# Altium schematic sheet fpga_map.SchDoc
size A4; SheetNumber: 4; SheetTotal: 4
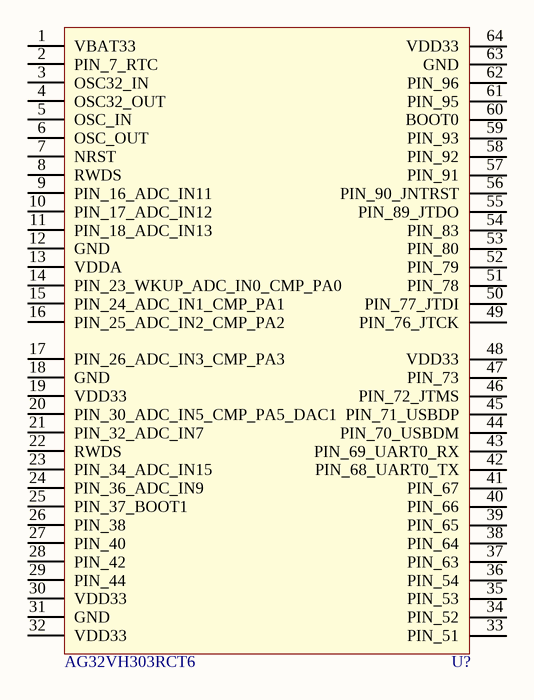
[diagram p0: fpga_map.SchDoc]

## Parts
U?  AG32VH303RCT6  [LQFP64]

## Nets

Not connected (* = marked no-connect by the designer): U? 1(VBAT33) 2(PIN_7_RTC) 3(OSC32_IN) 4(OSC32_OUT) 5(OSC_IN) 6(OSC_OUT) 7(NRST) 8(RWDS) 9(PIN_16_ADC_IN11) 10(PIN_17_ADC_IN12) 11(PIN_18_ADC_IN13) 12(GND) 13(VDDA) 14(PIN_23_WKUP_ADC_IN0_CMP_PA0) 15(PIN_24_ADC_IN1_CMP_PA1) 16(PIN_25_ADC_IN2_CMP_PA2) 17(PIN_26_ADC_IN3_CMP_PA3) 18(GND) 19(VDD33) 20(PIN_30_ADC_IN5_CMP_PA5_DAC1) 21(PIN_32_ADC_IN7) 22(RWDS) 23(PIN_34_ADC_IN15) 24(PIN_36_ADC_IN9) 25(PIN_37_BOOT1) 26(PIN_38) 27(PIN_40) 28(PIN_42) 29(PIN_44) 30(VDD33) 31(GND) 32(VDD33) 33(PIN_51) 34(PIN_52) 35(PIN_53) 36(PIN_54) 37(PIN_63) 38(PIN_64) 39(PIN_65) 40(PIN_66) 41(PIN_67) 42(PIN_68_UART0_TX) 43(PIN_69_UART0_RX) 44(PIN_70_USBDM) 45(PIN_71_USBDP) 46(PIN_72_JTMS) 47(PIN_73) 48(VDD33) 49(PIN_76_JTCK) 50(PIN_77_JTDI) 51(PIN_78) 52(PIN_79) 53(PIN_80) 54(PIN_83) 55(PIN_89_JTDO) 56(PIN_90_JNTRST) 57(PIN_91) 58(PIN_92) 59(PIN_93) 60(BOOT0) 61(PIN_95) 62(PIN_96) 63(GND) 64(VDD33)